# Altium project Type-C Tester.PrjPcb
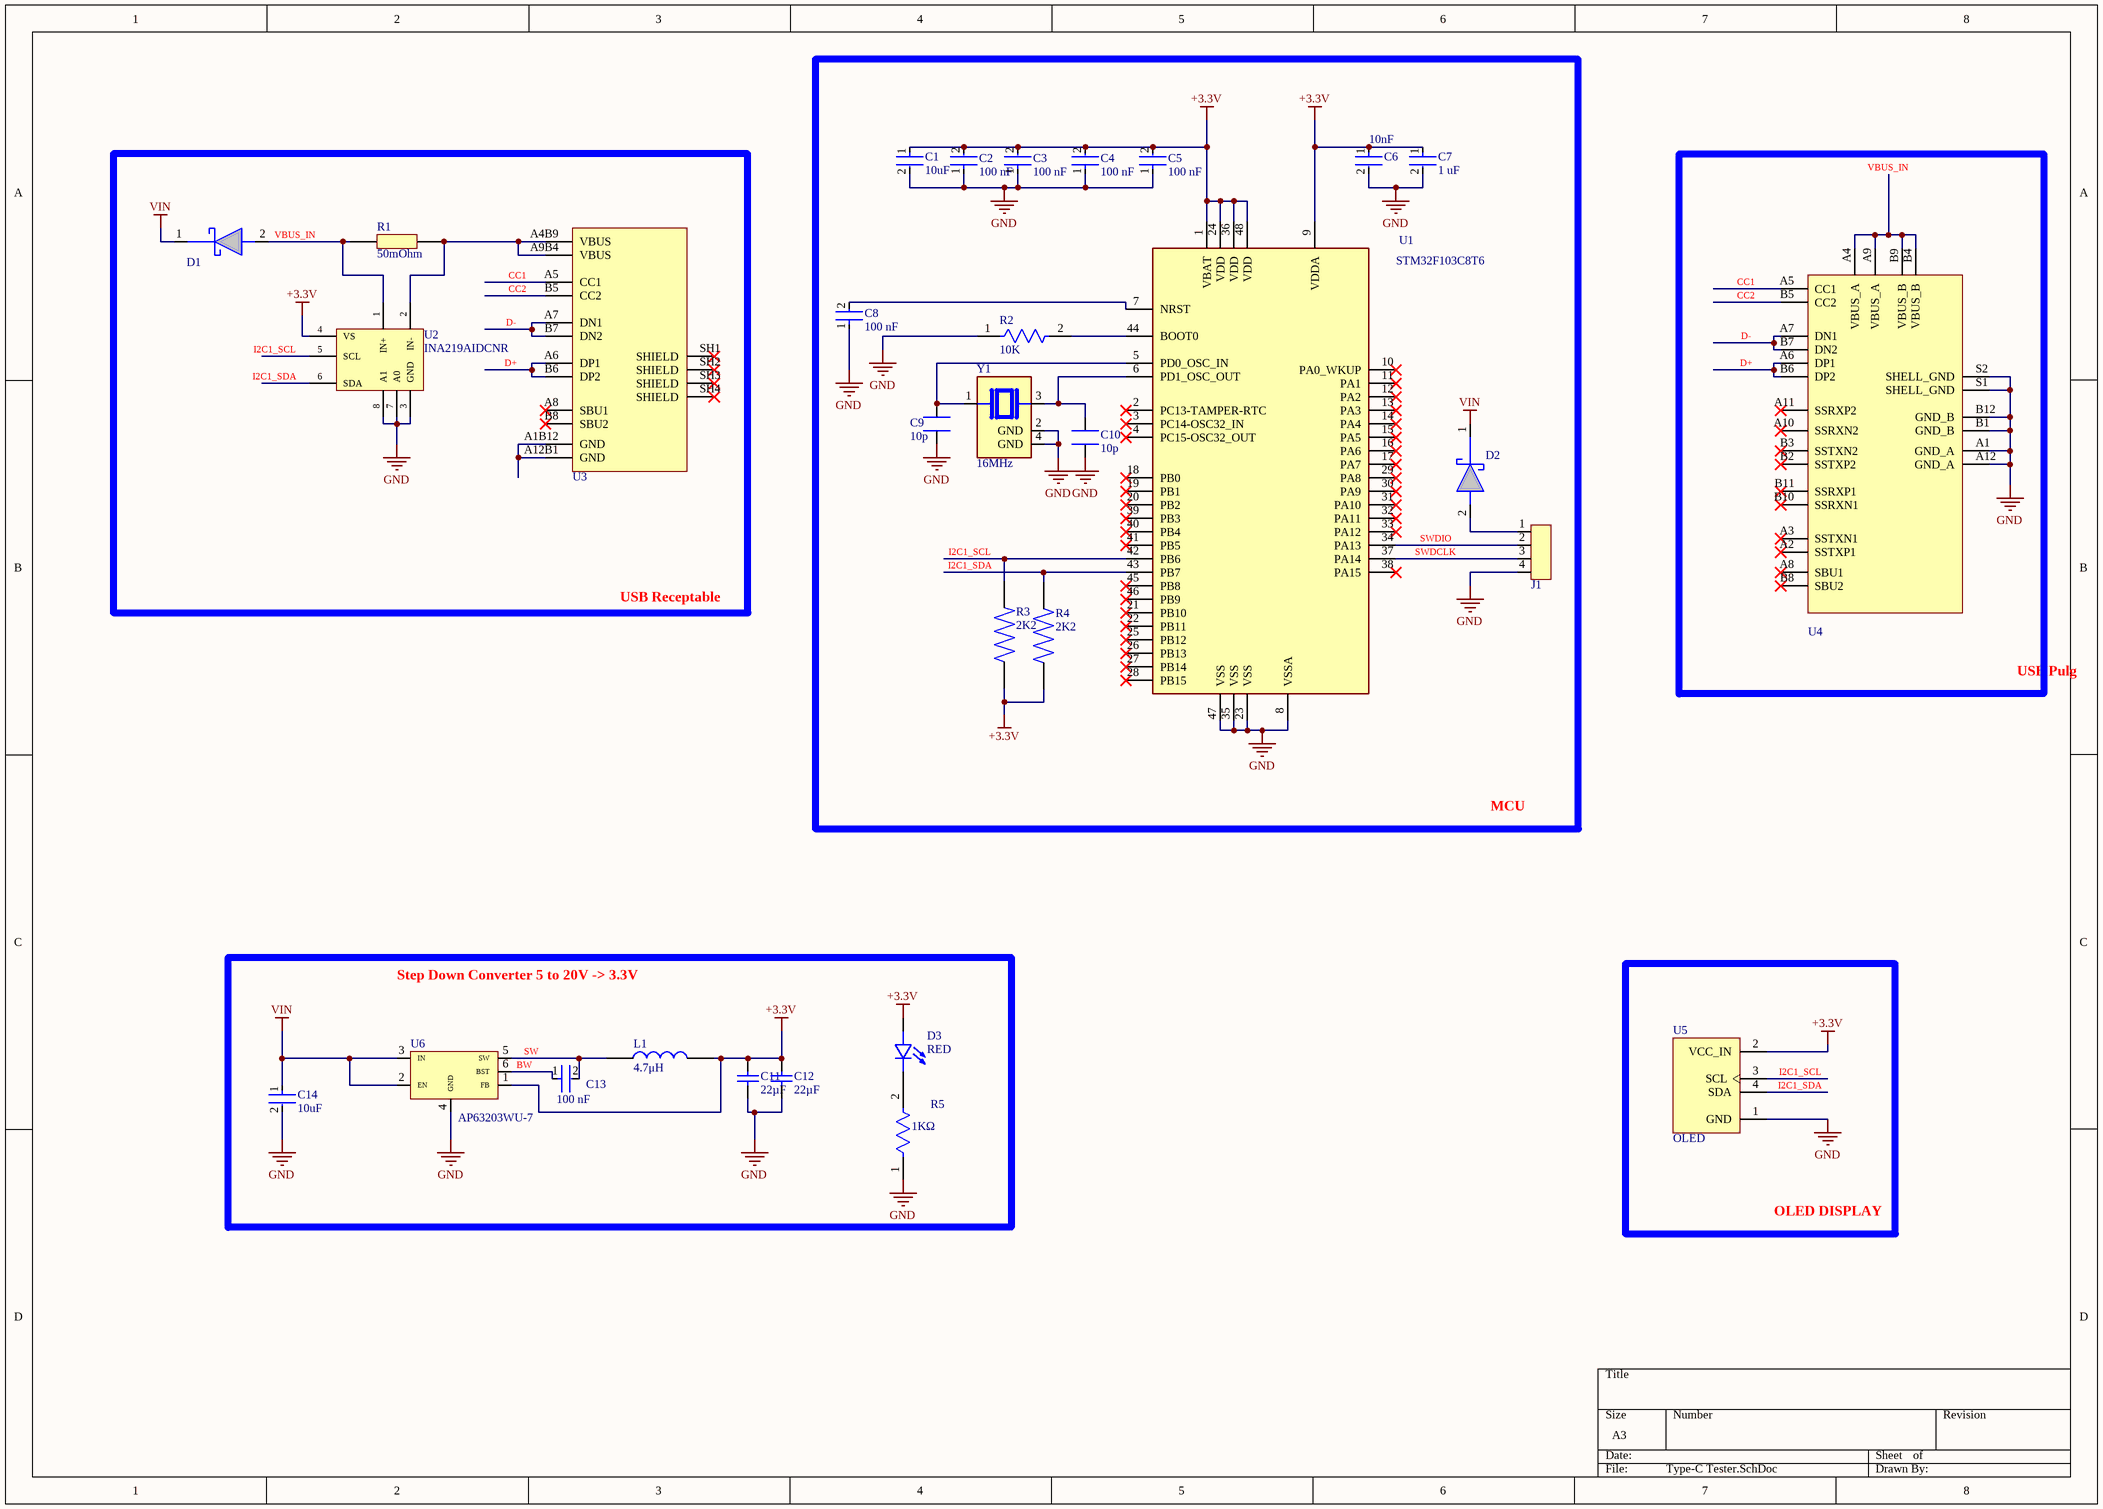
[diagram p0: Type-C Tester.SchDoc]
1 sheet, 31 parts. Net scope: global (net labels, ports and power ports of the same name join across sheets).
Board file: Type-C Tester.PcbDoc

## Sheet Type-C Tester.SchDoc
size A3; SheetNumber: 1; SheetTotal: 1

### Parts
C1  10uF  [FP-GRM21B-0_2-e0_2_0_7-IPC_A]
C2  Capacitance: 100 nF  [FP-CC0603-DA-MFG]  (hidden comment: CC0603KRX7R9BB104)
C3  Capacitance: 100 nF  [FP-CC0603-DA-MFG]  (hidden comment: CC0603KRX7R9BB104)
C4  Capacitance: 100 nF  [FP-CC0603-DA-MFG]  (hidden comment: CC0603KRX7R9BB104)
C5  Capacitance: 100 nF  [FP-CC0603-DA-MFG]  (hidden comment: CC0603KRX7R9BB104)
C6  Capacitance: 10nF  [FP-CL165-IPC_C]  (hidden comment: CL05B103KB5NNNC)
C7  Capacitance: 1 uF  [FP-CC0603-DA-MFG]  (hidden comment: CC0603KRX5R9BB105)
C8  Capacitance: 100 nF  [FP-CC0603-DA-MFG]  (hidden comment: CC0603KRX7R9BB104)
C9  value 10p  [CAPC1005X55N]  (hidden comment: CL05C100JB5NNNC)
C10  value 10p  [CAPC1005X55N]  (hidden comment: CL05C100JB5NNNC)
C11  Capacitance: 22µF  [CAPC2013X140X45LL15T25]  (hidden comment: CL21A226MAQNNNE)
C12  Capacitance: 22µF  [CAPC2013X140X45LL15T25]  (hidden comment: CL21A226MAQNNNE)
C13  Capacitance: 100 nF  [FP-CC0603-DA-MFG]  (hidden comment: CC0603KRX7R9BB104)
C14  10uF  [FP-GRM21B-0_2-e0_2_0_7-IPC_A]
D1  B5819WSL-TP  [B5819WSL]  (value not drawn)
D2  B5819WSL-TP  [B5819WSL]  (value not drawn)
D3  RED  [LED_KT-0603R]
J1  SWD  [SWD]  (value not drawn)
L1  4.7μH  [SMMS04204R7M]
R1  50mOhm  [RESC6432X110N]
R2  10K  [FP-TFCR0603-IPC_B]
R3  2K2  [RESC1005X40N]
R4  2K2  [RESC1005X40N]
R5  Resistance: 1KΩ  [FP-CRGCQ0402-IPC_C]  (hidden comment: CRGCQ0402F1K0)
U1  STM32F103C8T6  [QFP50P900X900X160-48N]
U2  INA219AIDCNR  [SOT65P280X145-8N]
U3  KH-TYPE-C-16P  [KINGHELM_KH-TYPE-C-16P]  (value not drawn)
U4  USB4155-03-C  [GCT_USB4155-03-C_REVA]  (value not drawn)
U5  OLED  [MODULE_DM-OLED096-636]
U6  AP63203WU-7  [FP-TSOT26-IPC_A]
Y1  16MHz  [XTAL_ABM10-16.000MHZ-D30-T3]

### Blocks framed on the sheet
MCU: C1-C10 D2 J1 R2-R4 U1 Y1
USB Receptable: D1 R1 U2 U3
USB Pulg: U4
Step Down Converter 5 to 20V -> 3.3V: C11-C14 D3 L1 R5 U6
OLED DISPLAY: U5

### Nets
+3.3V: C1.1 C2.2 C3.2 C4.2 C5.2 C6.1 C7.1 C11.2 C12.2 D3.A L1.2(-) R3.1 R4.1 U1.1(VBAT) U1.9(VDDA) U1.24(VDD) U1.36(VDD) U1.48(VDD) U2.4(VS) U5.2(VCC_IN) U6.1(FB)
GND: C1.2 C2.1 C3.1 C4.1 C5.1 C6.2 C7.2 C8.1 C9.1 C10.1 C11.1 C12.1 C14.2 J1.4 R2.1 R5.1 U1.8(VSSA) U1.23(VSS) U1.35(VSS) U1.47(VSS) U2.3(GND) U2.7(A0) U2.8(A1) U4.A1(GND_A) U4.A12(GND_A) U4.B1(GND_B) U4.B12(GND_B) U4.S1(SHELL_GND) U4.S2(SHELL_GND) U5.1(GND) U6.4(GND) Y1.2(GND) Y1.4(GND)
VIN: C14.1 D1.1(K) D2.1(K) U6.2(EN) U6.3(IN)
BW: C13.1 U6.6(BST)
CC1: U3.A5(CC1) U4.A5(CC1)
CC2: U3.B5(CC2) U4.B5(CC2)
D+: U3.A6(DP1) U3.B6(DP2) U4.A6(DP1) U4.B6(DP2)
D-: U3.A7(DN1) U3.B7(DN2) U4.A7(DN1) U4.B7(DN2)
I2C1_SCL: R3.2 U1.42(PB6) U2.5(SCL) U5.3(SCL)
I2C1_SDA: R4.2 U1.43(PB7) U2.6(SDA) U5.4(SDA)
SW: C13.2 L1.1(+) U6.5(SW)
SWDCLK: J1.3 U1.37(PA14)
SWDIO: J1.2 U1.34(PA13)
VBUS_IN: D1.2(A) R1.1 U2.1(IN+) U4.A4(VBUS_A) U4.A9(VBUS_A) U4.B4(VBUS_B) U4.B9(VBUS_B)
NetC8_2: C8.2 U1.7(NRST)
NetC9_2: C9.2 U1.5(PD0_OSC_IN) Y1.1
NetC10_2: C10.2 U1.6(PD1_OSC_OUT) Y1.3
NetD2_2: D2.2(A) J1.1
NetD3_C: D3.C R5.2
NetR1_2: R1.2 U2.2(IN-) U3.A4B9(VBUS) U3.A9B4(VBUS)
NetR2_2: R2.2 U1.44(BOOT0)
NetU3_A1B12: U3.A1B12(GND) U3.A12B1(GND)

Not connected (* = marked no-connect by the designer): U1 2(PC13-TAMPER-RTC)* 3(PC14-OSC32_IN)* 4(PC15-OSC32_OUT)* 10(PA0_WKUP)* 11(PA1)* 12(PA2)* 13(PA3)* 14(PA4)* 15(PA5)* 16(PA6)* 17(PA7)* 18(PB0)* 19(PB1)* 20(PB2)* 21(PB10)* 22(PB11)* 25(PB12)* 26(PB13)* 27(PB14)* 28(PB15)* 29(PA8)* 30(PA9)* 31(PA10)* 32(PA11)* 33(PA12)* 38(PA15)* 39(PB3)* 40(PB4)* 41(PB5)* 45(PB8)* 46(PB9)*; U3 A8(SBU1)* B8(SBU2)* SH1(SHIELD)* SH2(SHIELD)* SH3(SHIELD)* SH4(SHIELD)*; U4 A2(SSTXP1)* A3(SSTXN1)* A8(SBU1)* A10(SSRXN2)* A11(SSRXP2)* B2(SSTXP2)* B3(SSTXN2)* B8(SBU2)* B10(SSRXN1)* B11(SSRXP1)*

### Library data of the parts
C1 C14 = CMP-06035-004402-1: Chip Multilayer Ceramic Capacitors for General Purpose, 0805, 10uF, X5R, 15%, 10%, 50V; Voltage Rating (DC): 50V; Dielectric: X5R; Tolerance: 10%; Capacitance: 10uF; Thickness: 1.25mm; Length: 2mm; Width: 1.25mm; LCSC PART: C440198
C2-C5 C8 C13 = CMP-2100-03601-2: CAP CER 0.1UF 50V X7R 0603; Manufacturer: YAGEO; Material: Ceramic; Temperature Coefficient: 15%; Tolerance: 0.1; Value: 100 nF; Height: 0.9mm; Voltage: 50 V; ComponentLink2Description: Datasheet; Device Class L2: Capacitors; Temperature Range High: +125°C; Category: Cap; Footprint Url: http://www.yageo.com/exep/pages/download/literatures/UPY-C_GEN_24.pdf; ComponentLink2URL: http://www.yageo.com/documents/recent/UPY-GPHC_X7R_6.3V-to-50V_18.pdf; Package: CC0603-DA; Temperature: -55°C to +125°C; Voltage Rating: 50 V; Temperature Characteristic: X7R; Device Class L1: Passive Components; Temperature Range Low: -55°C; Manufacturer Part Number: CC0603KRX7R9BB104; RoHS: TRUE; Automotive: No; Device Class L3: Ceramic Capacitors; Octopart: https://octopart.com/cc0603krx7r9bb104-yageo-42244635; Mouser Description: Multilayer Ceramic Capacitor, CC Series, 0.1 - F, - 10%, X7R, 50 V, 0603 [1608 Metric]; Lead Free: Yes; Digikey Description: CAP CER 0.1UF 50V X7R 0603; LCSC PART: C14663
C6 = CMP-13271-000387-1: Cap Ceramic 10nF 50V X7R ±10% SMD 0402 +125°C Paper T/R; Depth: 0.5mm; Length: 1mm; Lead Free: Lead Free; Case Code (Metric): 1005; Width: 0.02inch; Min Operating Temperature: -55°C; Thickness: 0.022inch; Package Quantity: 1; Mount: Surface Mount; Height: 0.5mm; Voltage: 50V; Material: Ceramic; Tolerance: 10%; Case Code (Imperial): 0402; Radiation Hardening: No; Case/Package: 0402; Max Operating Temperature: 125°C; Voltage Rating (DC): 50V; Contact Plating: Tin; Packaging: Tape and Reel; Voltage Rating: 50V; Dielectric: X7R
C7 = CMP-03422-001112-1: CAP CER 1UF 50V X5R 0603; Manufacturer: YAGEO; Tolerance: 0.1; Material: Ceramic; Temperature Coefficient: 15%; Lead Free: Yes; Height: 0.9mm; Temperature Characteristic: X5R; Mouser Description: Multilayer Ceramic Capacitors MLCC - SMD/SMT 1M pF 10% 50 Volts; Value: 1 uF; Octopart: https://octopart.com/cc0603krx5r9bb105-yageo-48690813; Voltage: 50 V; Device Class L3: Ceramic Capacitors; ComponentLink2URL: http://www.yageo.com/documents/recent/UPY-GPHC_X7R_6.3V-to-50V_18.pdf; Temperature: -55°C to +125°C; Device Class L1: Passive Components; Automotive: No; Temperature Range High: +125°C; Voltage Rating: 50 V; Temperature Range Low: -55°C; Category: Cap; Footprint Url: http://www.yageo.com/exep/pages/download/literatures/UPY-C_GEN_24.pdf; RoHS: TRUE; Manufacturer Part Number: CC0603KRX5R9BB105; Package: CC0603-DA; Device Class L2: Capacitors; Digikey Description: CAP CER 1UF 50V X5R 0603; ComponentLink2Description: Datasheet
C9 C10 = CL05C100JB5NNNC: 10 pF Â±5% 50V Ceramic Capacitor C0G, NP0 0402 (1005 Metric); MF: Samsung Electro-Mechanics; SnapEDA_Link: https://www.snapeda.com/parts/CL05C100JB5NNNC/Samsung/view-part/?ref=snap; Package: SMD-2-2 Samsung; MP: CL05C100JB5NNNC; Check_prices: https://www.snapeda.com/parts/CL05C100JB5NNNC/Samsung/view-part/?ref=eda
C11 C12 = CMP-2000-06104-1: Multi-layer Ceramic Capacitor, 22 uF, -55 to 85 degC, 2-Pin SMD (0805), RoHS, Tape and Reel; Manufacturer: Samsung Electro-Mechanics; Voltage - Rated: 25V; Other Names: 1276-2908-2; Featured Product: Multi-LayerCeramicCapacitors; Product Training Modules: HighCapMLCCFamily; Temperature Coefficient: X5R; Tolerance: ±20%; Online Catalog: CLSeries,HighCapacitance; Applications: GeneralPurpose; RoHS Information: MLCCRoHS2Compliance; Height - Seated (Max): -; Lead Style: -; Lead Spacing: -; Datasheet URL: http://datasheet.octopart.com/CL21A226MAQNNNE-Samsung-datasheet-48647558.pdf; Size / Dimension: 0.079"Lx0.049"W(2.00mmx1.25mm); Thickness (Max): 0.055"(1.40mm); Family: CeramicCapacitors; Package Description: 2-Pin Surface Mount Device, Body 2.0 x 1.25 mm; Datasheet Version: 07/2015; Packaging: Tape&Reel(TR); Manufacturer URL: http://www.samsungsem.com/global/index.jsp; Ratings: -; Package / Case: 0805(2012Metric); Standard Package: 2,000; Mounting Type: SurfaceMount,MLCC; Mounting Technology: SurfaceMount; Category: Capacitors; Package Reference: 0805; Series: CL; Features: -; Operating Temperature: -55°C~85°C; LCSC PART: C45783
D1 D2 = B5819WSL-TP: Rectifier Diode, Schottky, 1 Phase, 1 Element, 1A, 40V V(RRM), Silicon; Manufacturer: MCC; Forward Voltage: 600mV; Max Forward Surge Current (Ifsm): 10A; Max Power Dissipation: 250mW; Number of Elements: 1; Peak Reverse Current: 50µA; Supplier: Future Electronics; Supplier Part Number: B5819WSL-TP; Manufacturer Part Number: B5819WSL-TP; RoHS: Compliant; Category: Rectifier Diodes; Stock: 3000; Pricing: 3000=0.0379, 9000=0.037, 15000=0.0366, 45000=0.0357, 75000=0.0349 (USD); China RoHS: Compliant; Lifecycle Status: Production; Max Operating Temperature: 125°C; Max Output current: 1A; Min Operating Temperature: -65°C; Number of Terminals: 2; REACH SVHC: Unaffected; Reverse Standoff Voltage: 40V
D3 = KT-0603R: Unchecked KT-0603R 615nm~630nm 120° 1.9V~2.2V red 0603 SMD mount 1.6mm*800μm*700μm Uncategorized
L1 = SMMS0420-4R7M: Manufacturer Part Description Category Supply Info / Unchecked SMMS0420-4R7M 4.7μH ±20% 3A Inductor Uncategorized
R1 = HoJLR2512-2W-50mR-1%: Unchecked HOJLR2512-2W-50MR-1% 2512 Alloy Resistor, 0.05Ω ±1%, 50ppm, 2W Chip SMD Resistors
R2 = CMP-250906-158435-1: RES Thin Film,  10kΩ, 1%, 0.1W, 100ppm/°C, 0603
R3 R4 = 0402WGF2201TCE: Unchecked RND 1550402WGF2201TCE SMD Resistor Dimensions L x W x H: 1 x 0.5 x 0.35 mm Temperature range: -55 ... 155 °C Construction form: 0402... Uncategorized      100ppm/°C
R5 = CMP-03211-006314-1: CRGCQ0402 1KΩ 1% ±100ppm/°C 50V; Manufacturer: TE Connectivity; Power Rating: 0.0625W; Tolerance: 0.01; Composition: Thick Film; Voltage Rating: 50V; Device Class L2: Resistors; Package: CRGCQ0402; Manufacturer Part Number: CRGCQ0402F1K0; Temperature Range High: +155°C; Device Class L3: Chip SMD Resistors; Automotive: Yes; Value: 1KΩ; Ambient Temperature Range High: +70°C; Temperature Range Low: -55°C; Temperature: -55°C to +155°C; Device Class L1: Passive Components; Height: 0.4mm; Series: CRGCQ; Lead Free: Yes; ComponentLink2URL: https://www.te.com/commerce/DocumentDelivery/DDEController?Action=showdoc&DocId=Data+Sheet%7F1773204-3%7F1%7Fpdf%7FEnglish%7FENG_DS_1773204-3_1.pdf%7F4-2176347-694; Category: Res; Octopart: https://octopart.com/crgcq0402f1k0-te+connectivity-91017946; RoHS: TRUE; ComponentLink2Description: Datasheet; Ipc Land Pattern Name: RESC10050X35; Temperature Coefficient: ±100ppm/°C
U1 = STM32F103C8T6: MCU 32-bit STM32F1 ARM Cortex M3 RISC 64KB Flash 2.5V/3.3V 48-Pin LQFP Tray; Manufacturer: STMicroelectronics; Manufacturer Package Identifier: ai14911d; ADC Channels (Resolution): 10-Ch 12-Bit; Address Bus Width: 32b; Density: 512kb; EEPROM Memory Size: 0B; Frequency: 72MHz; Interface: CAN, USB; Max Power Dissipation: 363mW; Max Supply Current: 50mA; Max Supply Voltage: 3.6V; Min Supply Voltage: 2V; Nominal Supply Current: 1.7µA; Nominal Supply Voltage (DC): 3.3V; Number of A/D Converters: 2; Number of ADC Channels: 10; Number of Bits: 32; Number of I/Os: 37; Number of Interrupts: 16; Number of Programmable I/O: 48; Number of PWM Channels: 1; Number of Timers/Counters: 4; Number of USART Channels: 3; Oscillator Type: Internal; Peripherals: POR, RTC; RAM Size: 20kB; Watchdog Timer: Yes; Supplier: Avnet; Supplier Part Number: STM32F103C8T6; Manufacturer Part Number: STM32F103C8T6; RoHS: Compliant; Category: Microcontrollers; Stock: 41822; Pricing: 1=3.12425, 2=3.09755, 4=3.05349, 8=3.00943, 16=2.96537 (USD); Case/Package: LFQFP; China RoHS: Compliant; Core Architecture: ARM; Country of Origin: Malaysia; Data Bus Width: 32b; Export Control Classification Number (ECCN) Code: 3A991.A.2; Flash Memory Size: 64kB; Height: 1.45mm; Height - Seated (Max): 1.6mm; Harmonized Tariff Schedule (HTS) Code: 8542.31.00.25; Introduction Date: 2007-06-07; Lead Free: Lead Free; Length: 7mm; Lifecycle Status: Production; Clock Frequency: 72MHz; Max Operating Temperature: 85°C; Memory Size: 64kB; Memory Format: FLASH; Min Operating Temperature: -40°C; Mounting Technology: Surface Mount; Number of Channels: 10; Number of I2C Channels: 2; Pins: 48; Number of SPI Channels: 2; Number of Terminals: 48; Operating Supply Voltage: 3.6V; Radiation Hardening: No; REACH SVHC: Unaffected; Schedule B: 8542310000; Temperature Grade: Industrial; Terminal Pitch: 500µm; Termination: SMD/SMT; Width: 7mm; ComponentLink1URL: https://datasheet.octopart.com:443/STM32F103C8T6-STMicroelectronics-datasheet-177520228.pdf?src-supplier=IHS; ComponentLink1Description: https://datasheet.octopart.com:443/STM32F103C8T6-STMicroelectronics-datasheet-177520228.pdf?src-supplier=IHS; ComponentLink2URL: https://datasheet.octopart.com:443/STM32F103C8T6-STMicroelectronics-datasheet-10330614.pdf?src-supplier=Newark; ComponentLink2Description: https://datasheet.octopart.com:443/STM32F103C8T6-STMicroelectronics-datasheet-10330614.pdf?src-supplier=Newark; ComponentLink3URL: https://datasheet.octopart.com:443/STM32F103C8T6-STMicroelectronics-datasheet-16839800.pdf?src-supplier=Newark; ComponentLink3Description: https://datasheet.octopart.com:443/STM32F103C8T6-STMicroelectronics-datasheet-16839800.pdf?src-supplier=Newark; ComponentLink4URL: https://datasheet.octopart.com:443/STM32F103C8T6-STMicroelectronics-datasheet-48026265.pdf?src-supplier=ICpick; ComponentLink4Description: https://datasheet.octopart.com:443/STM32F103C8T6-STMicroelectronics-datasheet-48026265.pdf?src-supplier=ICpick; ComponentLink5URL: https://datasheet.octopart.com:443/STM32F103C8T6-STMicroelectronics-datasheet-14363502.pdf?src-supplier=Farnell; ComponentLink5Description: https://datasheet.octopart.com:443/STM32F103C8T6-STMicroelectronics-datasheet-14363502.pdf?src-supplier=Farnell; ComponentLink6URL: https://datasheet.octopart.com:443/STM32F103C8T6-STMicroelectronics-datasheet-500013.pdf?src-supplier=Farnell; ComponentLink6Description: https://datasheet.octopart.com:443/STM32F103C8T6-STMicroelectronics-datasheet-500013.pdf?src-supplier=Farnell; ComponentLink7URL: https://datasheet.octopart.com:443/STM32F103C8T6-STMicroelectronics-datasheet-8365036.pdf?src-supplier=Farnell; ComponentLink7Description: https://datasheet.octopart.com:443/STM32F103C8T6-STMicroelectronics-datasheet-8365036.pdf?src-supplier=Farnell; ComponentLink8URL: https://datasheet.octopart.com:443/STM32F103C8T6-STMicroelectronics-datasheet-6396519.pdf?src-supplier=Verical; ComponentLink8Description: https://datasheet.octopart.com:443/STM32F103C8T6-STMicroelectronics-datasheet-6396519.pdf?src-supplier=Verical; ComponentLink9URL: https://datasheet.octopart.com:443/STM32F103C8T6-STMicroelectronics-datasheet-21407612.pdf?src-supplier=element14+APAC; ComponentLink9Description: https://datasheet.octopart.com:443/STM32F103C8T6-STMicroelectronics-datasheet-21407612.pdf?src-supplier=element14+APAC; ComponentLink10URL: https://datasheet.octopart.com:443/STM32F103C8T6-STMicroelectronics-datasheet-8700640.pdf?src-supplier=element14; ComponentLink10Description: https://datasheet.octopart.com:443/STM32F103C8T6-STMicroelectronics-datasheet-8700640.pdf?src-supplier=element14; ComponentLink11URL: https://datasheet.octopart.com:443/STM32F103C8T6-STMicroelectronics-datasheet-165583531.pdf?src-supplier=SOS+electronic; ComponentLink11Description: https://datasheet.octopart.com:443/STM32F103C8T6-STMicroelectronics-datasheet-165583531.pdf?src-supplier=SOS+electronic; ComponentLink12URL: https://datasheet.octopart.com:443/STM32F103C8T6-STMicroelectronics-datasheet-14106722.pdf?src-supplier=iiiC; ComponentLink12Description: https://datasheet.octopart.com:443/STM32F103C8T6-STMicroelectronics-datasheet-14106722.pdf?src-supplier=iiiC; ComponentLink13URL: https://datasheet.octopart.com:443/STM32F103C8T6-STMicroelectronics-datasheet-17594274.pdf?src-supplier=TME; ComponentLink13Description: https://datasheet.octopart.com:443/STM32F103C8T6-STMicroelectronics-datasheet-17594274.pdf?src-supplier=TME; ComponentLink14URL: https://datasheet.octopart.com:443/STM32F103C8T6-STMicroelectronics-datasheet-148251.pdf?src-supplier=Nu+Horizons; ComponentLink14Description: https://datasheet.octopart.com:443/STM32F103C8T6-STMicroelectronics-datasheet-148251.pdf?src-supplier=Nu+Horizons
U2 = INA219AIDCNR: 26-V 12-bit I2C output digital power monitor 8-SOT-23 -40 to 125; Manufacturer: Texas Instruments; Manufacturer Lifecycle Status: ACTIVE; Accuracy: 1%; Bandwidth: 3.4MHz; Common Mode Rejection Ratio: 100dB; Input Offset Voltage (Vos): 100µV; Max Supply Voltage: 26V; Max Junction Temperature (Tj): 150°C; Max Supply Current: 5mA; Min Input Voltage: 0V; Min Supply Voltage: 3V; Nominal Supply Current: 700µA; Number of Amplifiers: 1; Operating Supply Current: 1mA; Output Current: 10mA; Supplier: DigiKey; Supplier Part Number: 296-23770-1-ND; RoHS: Compliant; Category: Amplifiers - Op Amps, Buffer, Instrumentation; Stock: 58711; Pricing: 1=2.25, 10=1.662, 25=1.5144, 100=1.3524, 250=1.2752, 500=1.23256, 1000=1.1628 (USD); Ambient Temperature Range High: 85°C; Case/Package: SOT-23; Contact Plating: Gold; Features: I²C; Height: 1.45mm; Lead Free: Lead Free; Length: 2.9mm; Lifecycle Status: Production; Max Operating Temperature: 125°C; Min Operating Temperature: -40°C; Number of Outputs: 1; Pins: 8; Output Current per Channel: 10mA; Output Type: Digital; Packaging: Cut Tape; Quiescent Current: 700µA; Radiation Hardening: No; REACH SVHC: Unaffected; Schedule B: 8542330000|8542330000|8542330000, 8542330000|8542330000|8542330000|8542330000|8542330000; Thickness: 1.1mm; Weight: 40.001177mg; Width: 1.63mm; ComponentLink1URL: https://octopart.com:443/opatz8j6/c1?t=mXNZEg2jyD5NyCK_2W6ogI_3c8QRMbRBOLazAHLgy1JlwbZKZyH4b-YuevEo30JEQiTWwC8lz5Tbu-S38pmh9-XLDsCQsNBNDFv0ZPtEAh9Vx9mmiMtTyAa81OfucU8wswp56Gsbxy1LDfR57SITMeoX1a13NcXQgownNrkx-3rEAjCgj7TNf5q988t_Bmtd28MfB-8YodPlVf_HWBaA_YkKbVFMmS-K4EDTzxfG14L7W23rjhR5wMtYaOji5q7itKD0VWsI_Pl-rAba6SpMOYnl8B8vEq--hemeyXquqfeQYa1YyvXap_3pa6lat1BXqCZqGMe0qTFNLIcuieQkNoJTlJe9aMEd3u-pqstJoCS5-cCrgu3PAF_v80BJAeKwFj4S&src-supplier=Texas+Instruments; ComponentLink1Description: https://octopart.com:443/opatz8j6/c1?t=mXNZEg2jyD5NyCK_2W6ogI_3c8QRMbRBOLazAHLgy1JlwbZKZyH4b-YuevEo30JEQiTWwC8lz5Tbu-S38pmh9-XLDsCQsNBNDFv0ZPtEAh9Vx9mmiMtTyAa81OfucU8wswp56Gsbxy1LDfR57SITMeoX1a13NcXQgownNrkx-3rEAjCgj7TNf5q988t_Bmtd28MfB-8YodPlVf_HWBaA_YkKbVFMmS-K4EDTzxfG14L7W23rjhR5wMtYaOji5q7itKD0VWsI_Pl-rAba6SpMOYnl8B8vEq--hemeyXquqfeQYa1YyvXap_3pa6lat1BXqCZqGMe0qTFNLIcuieQkNoJTlJe9aMEd3u-pqstJoCS5-cCrgu3PAF_v80BJAeKwFj4S&src-supplier=Texas+Instruments; ComponentLink2URL: https://datasheet.octopart.com:443/INA219AIDCNR-Texas-Instruments-datasheet-10383171.pdf?src-supplier=Texas+Instruments; ComponentLink2Description: https://datasheet.octopart.com:443/INA219AIDCNR-Texas-Instruments-datasheet-10383171.pdf?src-supplier=Texas+Instruments; ComponentLink3URL: https://datasheet.octopart.com:443/INA219AIDCNR-Texas-Instruments-datasheet-10258484.pdf?src-supplier=Texas+Instruments; ComponentLink3Description: https://datasheet.octopart.com:443/INA219AIDCNR-Texas-Instruments-datasheet-10258484.pdf?src-supplier=Texas+Instruments; ComponentLink4URL: https://sigma.octopart.com:443/49252122/technical_drawing/Texas-Instruments-INA219AIDCNR.pdf?src-supplier=Texas+Instruments; ComponentLink4Description: https://sigma.octopart.com:443/49252122/technical_drawing/Texas-Instruments-INA219AIDCNR.pdf?src-supplier=Texas+Instruments; ComponentLink5URL: https://datasheet.octopart.com:443/INA219AIDCNR-Texas-Instruments-datasheet-102489495.pdf?src-supplier=Upverter; ComponentLink5Description: https://datasheet.octopart.com:443/INA219AIDCNR-Texas-Instruments-datasheet-102489495.pdf?src-supplier=Upverter; ComponentLink6URL: https://datasheet.octopart.com:443/INA219AIDCNR-Texas-Instruments-datasheet-11538655.pdf?src-supplier=Future+Electronics; ComponentLink6Description: https://datasheet.octopart.com:443/INA219AIDCNR-Texas-Instruments-datasheet-11538655.pdf?src-supplier=Future+Electronics; ComponentLink7URL: https://datasheet.octopart.com:443/INA219AIDCNR-Texas-Instruments-datasheet-137316104.pdf?src-supplier=Future+Electronics; ComponentLink7Description: https://datasheet.octopart.com:443/INA219AIDCNR-Texas-Instruments-datasheet-137316104.pdf?src-supplier=Future+Electronics; ComponentLink8URL: https://datasheet.octopart.com:443/INA219AIDCNR-Texas-Instruments-datasheet-24897021.pdf?src-supplier=element14+APAC; ComponentLink8Description: https://datasheet.octopart.com:443/INA219AIDCNR-Texas-Instruments-datasheet-24897021.pdf?src-supplier=element14+APAC; ComponentLink9URL: https://datasheet.octopart.com:443/INA219AIDCNR.-Texas-Instruments-datasheet-62277359.pdf?src-supplier=element14+APAC; ComponentLink9Description: https://datasheet.octopart.com:443/INA219AIDCNR.-Texas-Instruments-datasheet-62277359.pdf?src-supplier=element14+APAC; ComponentLink10URL: https://datasheet.octopart.com:443/INA219AIDCNR-Texas-Instruments-datasheet-164414650.pdf?src-supplier=SHENGYU+ELECTRONICS; ComponentLink10Description: https://datasheet.octopart.com:443/INA219AIDCNR-Texas-Instruments-datasheet-164414650.pdf?src-supplier=SHENGYU+ELECTRONICS; ComponentLink11URL: https://datasheet.octopart.com:443/INA219AIDCNR-Texas-Instruments-datasheet-159115060.pdf?src-supplier=LCSC; ComponentLink11Description: https://datasheet.octopart.com:443/INA219AIDCNR-Texas-Instruments-datasheet-159115060.pdf?src-supplier=LCSC; ComponentLink12URL: https://datasheet.octopart.com:443/INA219AIDCNR-Texas-Instruments-datasheet-140571431.pdf?src-supplier=Arrow.cn; ComponentLink12Description: https://datasheet.octopart.com:443/INA219AIDCNR-Texas-Instruments-datasheet-140571431.pdf?src-supplier=Arrow.cn; ComponentLink13URL: https://datasheet.octopart.com:443/INA219AIDCNR-Texas-Instruments-datasheet-14155040.pdf?src-supplier=iiiC; ComponentLink13Description: https://datasheet.octopart.com:443/INA219AIDCNR-Texas-Instruments-datasheet-14155040.pdf?src-supplier=iiiC; ComponentLink14URL: http://sigma.octopart.com:80/reach_statement/Texas-Instruments-company-64.pdf?src-supplier=Compliance+Statements; ComponentLink14Description: http://sigma.octopart.com:80/reach_statement/Texas-Instruments-company-64.pdf?src-supplier=Compliance+Statements; ComponentLink15URL: http://sigma.octopart.com:80/conflict_mineral_statement/Texas-Instruments-company-63.pdf?src-supplier=Compliance+Statements; ComponentLink15Description: http://sigma.octopart.com:80/conflict_mineral_statement/Texas-Instruments-company-63.pdf?src-supplier=Compliance+Statements; Manufacturer Part Number: INA219AIDCNR
U3 = KH-TYPE-C-16P: Unchecked KH-TYPE-C-16P 3A 1 Horizontal attachment 16P Female -40℃~+85℃ Type-C SMD USB Connectors ROHS Uncategorized
U4 = USB4155-03-C: USB Connector, 24 Contact(s), Female, Right Angle, Surface Mount Terminal, Plug; Manufacturer: Global Connector Technology; Contact Resistance: 50mΩ; Current Rating: 5A; Dielectric Material: Liquid Crystal Polymer; Insulation Resistance: 100MΩ; Number of Contacts: 24; Number of Ports: 1; Plating Thickness: 76.2nm; Row Spacing: 1.5mm; Voltage Rating: 20V; Supplier: DigiKey; Supplier Part Number: 2073-USB4155-03-CDKR-ND; Manufacturer Part Number: USB4155-03-C; RoHS: Compliant; Category: USB Connectors; Stock: 15032; Pricing: 1=1.66, 10=1.407, 25=1.3188, 50=1.2556, 100=1.1956, 250=1.12064, 500=1.06712 (USD); China RoHS: Compliant; Contact Material: Gold, Nickel; Gender: Female; Height: 2.1mm; Insulation Color: Black; Lifecycle Status: Production; Max Operating Temperature: 85°C; Min Operating Temperature: -30°C; Pins: 24; Number of Positions: 24; Number of Rows: 2; Orientation: Right Angle; REACH SVHC: Unaffected; Shell Finish: Nickel; Shell Material: Stainless Steel; Terminal Pitch: 500µm; ComponentLink1URL: https://datasheet.octopart.com:443/USB4155-03-C-GCT-datasheet-166933378.pdf?src-supplier=IHS; ComponentLink1Description: https://datasheet.octopart.com:443/USB4155-03-C-GCT-datasheet-166933378.pdf?src-supplier=IHS; ComponentLink2URL: https://datasheet.octopart.com:443/USB4155-03-C-GCT-datasheet-169726654.pdf?src-supplier=Future+Electronics; ComponentLink2Description: https://datasheet.octopart.com:443/USB4155-03-C-GCT-datasheet-169726654.pdf?src-supplier=Future+Electronics; ComponentLink3URL: https://datasheet.octopart.com:443/USB4155-03-C-Global-Connector-Technology-datasheet-152746743.pdf?src-supplier=Future+Electronics; ComponentLink3Description: https://datasheet.octopart.com:443/USB4155-03-C-Global-Connector-Technology-datasheet-152746743.pdf?src-supplier=Future+Electronics; ComponentLink4URL: https://datasheet.octopart.com:443/USB4155-03-C-GCT-datasheet-188945506.pdf?src-supplier=TME; ComponentLink4Description: https://datasheet.octopart.com:443/USB4155-03-C-GCT-datasheet-188945506.pdf?src-supplier=TME; ComponentLink5URL: https://datasheet.octopart.com:443/USB4155-03-C-GCT-datasheet-166929330.pdf?src-supplier=TME; ComponentLink5Description: https://datasheet.octopart.com:443/USB4155-03-C-GCT-datasheet-166929330.pdf?src-supplier=TME
U5 = DM-OLED096-636
U6 = AP63203WU-7: DC-DC Switching Step-Down Regulator, Fixed, 3.8V to 32V in, 3.3V out, 2A out, TSOT-26-6; Manufacturer: Diodes Inc.; Max Junction Temperature (Tj): 160°C; Max Output Voltage: 3.33V; Max Switching Frequency: 1.1MHz; Min Output Voltage: 3.27V; Nominal Supply Voltage: 12V; Nominal Supply Current: 22µA; Number of Circuits: 1; Topology: Buck; Supplier: Mouser; Supplier Part Number: 621-AP63203WU-7; Manufacturer Part Number: AP63203WU-7; RoHS: Compliant; Category: Voltage Regulators - Switching; Stock: 397; Pricing: 1=0.91, 10=0.67, 50=0.558, 100=0.513, 1000=0.513, 10000=0.411 (USD); Ambient Temperature Range High: 85°C; Case/Package: VSSOP; China RoHS: Compliant; Country of Origin: Mainland China; Export Control Classification Number (ECCN) Code: EAR99; Height: 1mm; Height - Seated (Max): 1mm; Harmonized Tariff Schedule (HTS) Code: 8542.39.00.60; Introduction Date: 2019-01-10; Length: 2.9mm; Lifecycle Status: Production; Max Supply Voltage: 32V; Max Operating Temperature: 85°C; Max Output current: 2A; Min Input Voltage: 3.8V; Min Operating Temperature: -40°C; Min Supply Voltage: 3.8V; Nominal Output Voltage: 3.3V; Number of Outputs: 1; Number of Terminals: 6; Output Current: 2A; Output Voltage: 3.3V; REACH SVHC: Unaffected; Switching Frequency: 1.1MHz; Terminal Pitch: 950µm; Width: 1.6mm; ComponentLink1URL: https://datasheet.octopart.com:443/AP63203WU-7-Diodes-Inc.-datasheet-130008827.pdf?src-supplier=IHS; ComponentLink1Description: https://datasheet.octopart.com:443/AP63203WU-7-Diodes-Inc.-datasheet-130008827.pdf?src-supplier=IHS; ComponentLink2URL: https://sigma.octopart.com:443/138799930/technical_drawing/Diodes-Inc.-AP63203WU-7.pdf?src-supplier=Diodes+Inc+SCT; ComponentLink2Description: https://sigma.octopart.com:443/138799930/technical_drawing/Diodes-Inc.-AP63203WU-7.pdf?src-supplier=Diodes+Inc+SCT
Y1 = ABM10-16.000MHZ-D30-T3: Crystal 16MHz ±20ppm (Tol) ±30ppm (Stability) 10pF FUND 150Ohm 4-Pin Ultra Mini-CSMD T/R; Manufacturer: Abracon; ESR (Equivalent Series Resistance): 150Ω; Frequency Tolerance: 0.002%; Supplier: DigiKey; Supplier Part Number: 535-10923-6-ND; Manufacturer Part Number: ABM10-16.000MHZ-D30-T3; RoHS: Compliant; Category: Crystals; Stock: 35847; Pricing: 1=1.2, 10=1.044, 25=0.9876, 50=0.9468, 100=0.9076, 250=0.85828, 500=0.82278, 1000=0.78877 (USD); Case/Package: CSMD; China RoHS: Compliant; Country of Origin: Taiwan; Depth: 2mm; Diameter: 500µm; Frequency: 16MHz; Frequency Stability: 30ppm; Height: 700µm; Height - Seated (Max): 500µm; Harmonized Tariff Schedule (HTS) Code: 8541.60.00.50; Introduction Date: 2012-05-08; Lead Free: Lead Free; Length: 2.5mm; Lifecycle Status: Production; Load Capacitance: 10pF; Max Operating Temperature: 85°C; Min Operating Temperature: -40°C; Mounting Technology: Surface Mount; Pins: 4; REACH SVHC: Unaffected; Schedule B: 8541600025, 8541600025|8541600025, 8541600025|8541600025|8541600025, 8541600025|8541600025|8541600025|8541600025; ESR: 150Ω; Termination: SMD/SMT; Tolerance: 0.002%; Width: 2mm; ComponentLink1URL: https://datasheet.octopart.com:443/ABM10-16.000MHZ-D30-T3-Abracon-datasheet-41232962.pdf?src-supplier=TME; ComponentLink1Description: https://datasheet.octopart.com:443/ABM10-16.000MHZ-D30-T3-Abracon-datasheet-41232962.pdf?src-supplier=TME; ComponentLink2URL: https://datasheet.octopart.com:443/ABM10-16.000MHZ-D30-T3-Abracon-datasheet-182204619.pdf?src-supplier=IHS; ComponentLink2Description: https://datasheet.octopart.com:443/ABM10-16.000MHZ-D30-T3-Abracon-datasheet-182204619.pdf?src-supplier=IHS; ComponentLink3URL: https://datasheet.octopart.com:443/ABM10-16.000MHZ-D30-T3-Abracon-datasheet-13380592.pdf?src-supplier=Upverter; ComponentLink3Description: https://datasheet.octopart.com:443/ABM10-16.000MHZ-D30-T3-Abracon-datasheet-13380592.pdf?src-supplier=Upverter; ComponentLink4URL: https://datasheet.octopart.com:443/ABM10-16.000MHZ-D30-T3-Abracon-datasheet-11045593.pdf?src-supplier=Upverter; ComponentLink4Description: https://datasheet.octopart.com:443/ABM10-16.000MHZ-D30-T3-Abracon-datasheet-11045593.pdf?src-supplier=Upverter; ComponentLink5URL: https://datasheet.octopart.com:443/ABM10-16.000MHZ-D30-T3-Abracon-datasheet-8882520.pdf?src-supplier=Upverter; ComponentLink5Description: https://datasheet.octopart.com:443/ABM10-16.000MHZ-D30-T3-Abracon-datasheet-8882520.pdf?src-supplier=Upverter; ComponentLink6URL: https://datasheet.octopart.com:443/ABM10-16.000MHZ-D30-T3-Abracon-datasheet-8456701.pdf?src-supplier=Upverter; ComponentLink6Description: https://datasheet.octopart.com:443/ABM10-16.000MHZ-D30-T3-Abracon-datasheet-8456701.pdf?src-supplier=Upverter; ComponentLink7URL: https://datasheet.octopart.com:443/ABM10-16.000MHZ-D30-T3-Abracon-datasheet-8326102.pdf?src-supplier=Upverter; ComponentLink7Description: https://datasheet.octopart.com:443/ABM10-16.000MHZ-D30-T3-Abracon-datasheet-8326102.pdf?src-supplier=Upverter; ComponentLink8URL: https://datasheet.octopart.com:443/ABM10-16.000MHZ-D30-T3-Abracon-datasheet-5401317.pdf?src-supplier=Upverter; ComponentLink8Description: https://datasheet.octopart.com:443/ABM10-16.000MHZ-D30-T3-Abracon-datasheet-5401317.pdf?src-supplier=Upverter; ComponentLink9URL: https://datasheet.octopart.com:443/ABM10-16.000MHZ-D30-T3-Abracon-datasheet-37124829.pdf?src-supplier=Newark; ComponentLink9Description: https://datasheet.octopart.com:443/ABM10-16.000MHZ-D30-T3-Abracon-datasheet-37124829.pdf?src-supplier=Newark; ComponentLink10URL: https://sigma.octopart.com:443/141159849/technical_drawing/Abracon-ABM10-16.000MHZ-D30-T3.pdf?src-supplier=Abracon+SCT; ComponentLink10Description: https://sigma.octopart.com:443/141159849/technical_drawing/Abracon-ABM10-16.000MHZ-D30-T3.pdf?src-supplier=Abracon+SCT; ComponentLink11URL: http://sigma.octopart.com:80/conflict_mineral_statement/Abracon-company-27.pdf?src-supplier=Compliance+Statements; ComponentLink11Description: http://sigma.octopart.com:80/conflict_mineral_statement/Abracon-company-27.pdf?src-supplier=Compliance+Statements